# Altium project SoM_RK3588.PrjPcb (part 4 of 6)
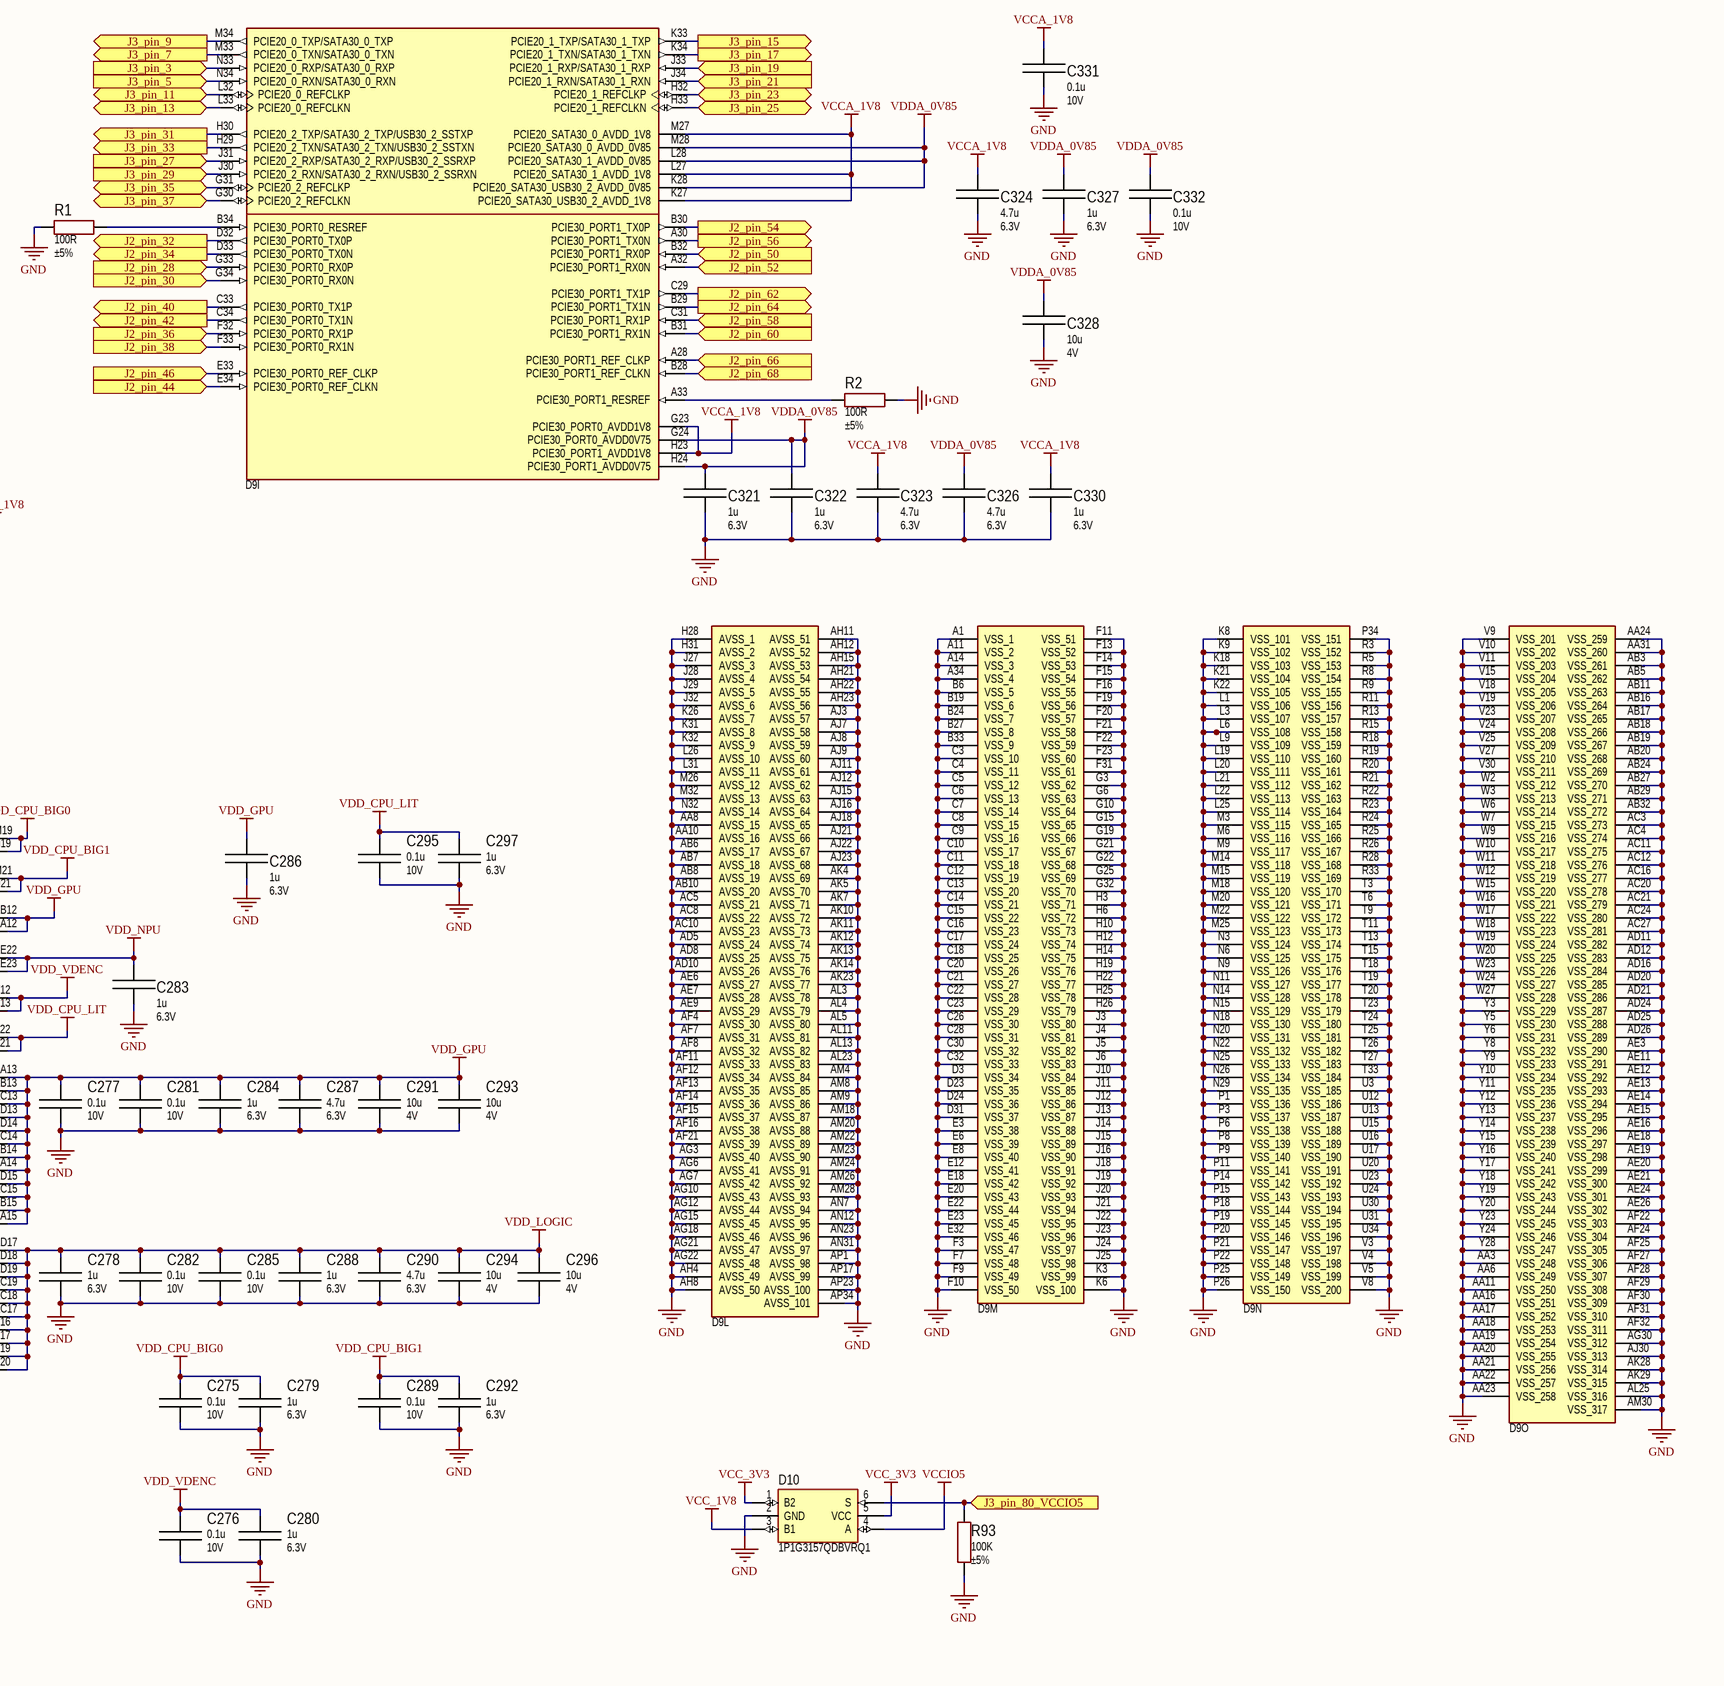
[diagram p23: 06_RK3588MQ.SchDoc, bottom right]

## Sheet 06_RK3588MQ.SchDoc (continued)

### Parts
C193  value 18p  Voltage: 50V  [CAPC1005X06N]  (hidden comment: C1005C0G1H180J050BA)
C194  value 1u  Voltage: 6.3V  [CAPC0603X03N]  (hidden comment: C0603X5R0J105M030BC)
C195  value 0.1u  Voltage: 10V  [CAPC0603X03N]  (hidden comment: C0603X5R1A104K030BC)
C196  value 1u  Voltage: 6.3V  [CAPC0603X03N]  (hidden comment: C0603X5R0J105M030BC)
C197  value 18p  Voltage: 50V  [CAPC1005X06N]  (hidden comment: C1005C0G1H180J050BA)
C198  value 0.1u  Voltage: 10V  [CAPC0603X03N]  (hidden comment: C0603X5R1A104K030BC)
C199  value 0.1u  Voltage: 10V  [CAPC0603X03N]  (hidden comment: C0603X5R1A104K030BC)
C200  value 1u  Voltage: 6.3V  [CAPC0603X03N]  (hidden comment: C0603X5R0J105M030BC)
C201  value 0.1u  Voltage: 10V  [CAPC0603X03N]  (hidden comment: C0603X5R1A104K030BC)
C202  value 0.1u  Voltage: 10V  [CAPC0603X03N]  (hidden comment: C0603X5R1A104K030BC)
C203  value 0.1u  Voltage: 10V  [CAPC0603X03N]  (hidden comment: C0603X5R1A104K030BC)
C204  value 1u  Voltage: 6.3V  [CAPC0603X03N]  (hidden comment: C0603X5R0J105M030BC)
C205  value 10u  Voltage: 4V  [CAPC1005X06N]  (hidden comment: CC0402MRX5R4BB106)
C206  value 10u  Voltage: 4V  [CAPC1005X06N]  (hidden comment: CC0402MRX5R4BB106)
C207  value 1u  Voltage: 6.3V  [CAPC0603X03N]  (hidden comment: C0603X5R0J105M030BC)
C208  value 4.7u  Voltage: 6.3V  [CAPC1005X06N]  (hidden comment: C1005X5R0J475K050BC)
C209  value 1u  Voltage: 6.3V  [CAPC0603X03N]  (hidden comment: C0603X5R0J105M030BC)
C210  value 1u  Voltage: 6.3V  [CAPC0603X03N]  (hidden comment: C0603X5R0J105M030BC)
C211  value 1u  Voltage: 6.3V  [CAPC0603X03N]  (hidden comment: C0603X5R0J105M030BC)
C212  value 0.1u  Voltage: 10V  [CAPC0603X03N]  (hidden comment: C0603X5R1A104K030BC)
C214  value 0.1u  Voltage: 10V  [CAPC0603X03N]  (hidden comment: C0603X5R1A104K030BC)
C215  value 1u  Voltage: 6.3V  [CAPC0603X03N]  (hidden comment: C0603X5R0J105M030BC)
C217  value 1u  Voltage: 6.3V  [CAPC0603X03N]  (hidden comment: C0603X5R0J105M030BC)
C219  value 0.1u  Voltage: 10V  [CAPC0603X03N]  (hidden comment: C0603X5R1A104K030BC)
C220  value 0.1u  Voltage: 10V  [CAPC0603X03N]  (hidden comment: C0603X5R1A104K030BC)
C223  value 0.1u  Voltage: 10V  [CAPC0603X03N]  (hidden comment: C0603X5R1A104K030BC)
C225  value 22u  Voltage: 6.3V  [CAPC1608X08N]  (hidden comment: C1608X5R0J226M080AC)
C227  value 10u  Voltage: 4V  [CAPC1005X06N]  (hidden comment: CC0402MRX5R4BB106)
C228  value 1u  Voltage: 6.3V  [CAPC0603X03N]  (hidden comment: C0603X5R0J105M030BC)
C230  value 10u  Voltage: 4V  [CAPC1005X06N]  (hidden comment: CC0402MRX5R4BB106)
C232  value 22u  Voltage: 6.3V  [CAPC1608X08N]  (hidden comment: C1608X5R0J226M080AC)
C233  value 1u  Voltage: 6.3V  [CAPC0603X03N]  (hidden comment: C0603X5R0J105M030BC)
C234  value 4.7u  Voltage: 6.3V  [CAPC1005X06N]  (hidden comment: C1005X5R0J475K050BC)
C235  value 22u  Voltage: 6.3V  [CAPC1608X08N]  (hidden comment: C1608X5R0J226M080AC)
C236  value 1u  Voltage: 6.3V  [CAPC0603X03N]  (hidden comment: C0603X5R0J105M030BC)
C240  value 1u  Voltage: 6.3V  [CAPC0603X03N]  (hidden comment: C0603X5R0J105M030BC)
C241  value 0.1u  Voltage: 10V  [CAPC0603X03N]  (hidden comment: C0603X5R1A104K030BC)
C243  value 10u  Voltage: 4V  [CAPC1005X06N]  (hidden comment: CC0402MRX5R4BB106)
C244  value 10u  Voltage: 4V  [CAPC1005X06N]  (hidden comment: CC0402MRX5R4BB106)
C245  value 10u  Voltage: 4V  [CAPC1005X06N]  (hidden comment: CC0402MRX5R4BB106)
C246  value 0.1u  Voltage: 10V  [CAPC0603X03N]  (hidden comment: C0603X5R1A104K030BC)
C247  value 1u  Voltage: 6.3V  [CAPC0603X03N]  (hidden comment: C0603X5R0J105M030BC)
C248  value 22u  Voltage: 6.3V  [CAPC1608X08N]  (hidden comment: C1608X5R0J226M080AC)
C249  value 10u  Voltage: 4V  [CAPC1005X06N]  (hidden comment: CC0402MRX5R4BB106)
C250  value 4.7u  Voltage: 6.3V  [CAPC1005X06N]  (hidden comment: C1005X5R0J475K050BC)
C251  value 4.7u  Voltage: 6.3V  [CAPC1005X06N]  (hidden comment: C1005X5R0J475K050BC)
C252  value 10u  Voltage: 4V  [CAPC1005X06N]  (hidden comment: CC0402MRX5R4BB106)
C253  value 0.1u  Voltage: 10V  [CAPC0603X03N]  (hidden comment: C0603X5R1A104K030BC)
C254  value 0.1u  Voltage: 10V  [CAPC0603X03N]  (hidden comment: C0603X5R1A104K030BC)
C255  value 10u  Voltage: 4V  [CAPC1005X06N]  (hidden comment: CC0402MRX5R4BB106)
C256  value 10u  Voltage: 4V  [CAPC1005X06N]  (hidden comment: CC0402MRX5R4BB106)
C257  value 1u  Voltage: 6.3V  [CAPC0603X03N]  (hidden comment: C0603X5R0J105M030BC)
C258  value 1u  Voltage: 6.3V  [CAPC0603X03N]  (hidden comment: C0603X5R0J105M030BC)
C259  value 1u  Voltage: 6.3V  [CAPC0603X03N]  (hidden comment: C0603X5R0J105M030BC)
C260  value 0.1u  Voltage: 10V  [CAPC0603X03N]  (hidden comment: C0603X5R1A104K030BC)
C261  value 1u  Voltage: 6.3V  [CAPC0603X03N]  (hidden comment: C0603X5R0J105M030BC)
C262  value 1u  Voltage: 6.3V  [CAPC0603X03N]  (hidden comment: C0603X5R0J105M030BC)
C263  value 1u  Voltage: 6.3V  [CAPC0603X03N]  (hidden comment: C0603X5R0J105M030BC)
C264  value 4.7u  Voltage: 6.3V  [CAPC1005X06N]  (hidden comment: C1005X5R0J475K050BC)
C265  value 1u  Voltage: 6.3V  [CAPC0603X03N]  (hidden comment: C0603X5R0J105M030BC)
C266  value 1u  Voltage: 6.3V  [CAPC0603X03N]  (hidden comment: C0603X5R0J105M030BC)
C267  value 0.1u  Voltage: 10V  [CAPC0603X03N]  (hidden comment: C0603X5R1A104K030BC)
C268  value 0.1u  Voltage: 10V  [CAPC0603X03N]  (hidden comment: C0603X5R1A104K030BC)
C269  value 0.1u  Voltage: 10V  [CAPC0603X03N]  (hidden comment: C0603X5R1A104K030BC)
C270  value 0.1u  Voltage: 10V  [CAPC0603X03N]  (hidden comment: C0603X5R1A104K030BC)
C271  value 0.1u  Voltage: 10V  [CAPC0603X03N]  (hidden comment: C0603X5R1A104K030BC)
C272  value 0.1u  Voltage: 10V  [CAPC0603X03N]  (hidden comment: C0603X5R1A104K030BC)
C273  value 10u  Voltage: 6.3V  [CAPC1608X08N]  (hidden comment: C1608X5R0J106K080AB)
C274  value 0.1u  Voltage: 10V  [CAPC0603X03N]  (hidden comment: C0603X5R1A104K030BC)
C275  value 0.1u  Voltage: 10V  [CAPC0603X03N]  (hidden comment: C0603X5R1A104K030BC)
C276  value 0.1u  Voltage: 10V  [CAPC0603X03N]  (hidden comment: C0603X5R1A104K030BC)
C277  value 0.1u  Voltage: 10V  [CAPC0603X03N]  (hidden comment: C0603X5R1A104K030BC)
C278  value 1u  Voltage: 6.3V  [CAPC0603X03N]  (hidden comment: C0603X5R0J105M030BC)
C279  value 1u  Voltage: 6.3V  [CAPC0603X03N]  (hidden comment: C0603X5R0J105M030BC)
C280  value 1u  Voltage: 6.3V  [CAPC0603X03N]  (hidden comment: C0603X5R0J105M030BC)
C281  value 0.1u  Voltage: 10V  [CAPC0603X03N]  (hidden comment: C0603X5R1A104K030BC)
C282  value 0.1u  Voltage: 10V  [CAPC0603X03N]  (hidden comment: C0603X5R1A104K030BC)
C283  value 1u  Voltage: 6.3V  [CAPC0603X03N]  (hidden comment: C0603X5R0J105M030BC)
C284  value 1u  Voltage: 6.3V  [CAPC0603X03N]  (hidden comment: C0603X5R0J105M030BC)
C285  value 0.1u  Voltage: 10V  [CAPC0603X03N]  (hidden comment: C0603X5R1A104K030BC)
C286  value 1u  Voltage: 6.3V  [CAPC0603X03N]  (hidden comment: C0603X5R0J105M030BC)
C287  value 4.7u  Voltage: 6.3V  [CAPC1005X06N]  (hidden comment: C1005X5R0J475K050BC)
C288  value 1u  Voltage: 6.3V  [CAPC0603X03N]  (hidden comment: C0603X5R0J105M030BC)
C289  value 0.1u  Voltage: 10V  [CAPC0603X03N]  (hidden comment: C0603X5R1A104K030BC)
C290  value 4.7u  Voltage: 6.3V  [CAPC1005X06N]  (hidden comment: C1005X5R0J475K050BC)
C291  value 10u  Voltage: 4V  [CAPC1005X06N]  (hidden comment: CC0402MRX5R4BB106)
C292  value 1u  Voltage: 6.3V  [CAPC0603X03N]  (hidden comment: C0603X5R0J105M030BC)
C293  value 10u  Voltage: 4V  [CAPC1005X06N]  (hidden comment: CC0402MRX5R4BB106)
C294  value 10u  Voltage: 4V  [CAPC1005X06N]  (hidden comment: CC0402MRX5R4BB106)
C295  value 0.1u  Voltage: 10V  [CAPC0603X03N]  (hidden comment: C0603X5R1A104K030BC)
C296  value 10u  Voltage: 4V  [CAPC1005X06N]  (hidden comment: CC0402MRX5R4BB106)
C297  value 1u  Voltage: 6.3V  [CAPC0603X03N]  (hidden comment: C0603X5R0J105M030BC)
C303  value 0.1u  Voltage: 10V  [CAPC0603X03N]  (hidden comment: C0603X5R1A104K030BC)
C304  value 1u  Voltage: 6.3V  [CAPC0603X03N]  (hidden comment: C0603X5R0J105M030BC)
C305  value 0.1u  Voltage: 10V  [CAPC0603X03N]  (hidden comment: C0603X5R1A104K030BC)
C306  value 0.1u  Voltage: 10V  [CAPC0603X03N]  (hidden comment: C0603X5R1A104K030BC)
C307  value 0.1u  Voltage: 10V  [CAPC0603X03N]  (hidden comment: C0603X5R1A104K030BC)
C308  value 0.1u  Voltage: 10V  [CAPC0603X03N]  (hidden comment: C0603X5R1A104K030BC)
C309  value 0.1u  Voltage: 10V  [CAPC0603X03N]  (hidden comment: C0603X5R1A104K030BC)
C310  value 1u  Voltage: 6.3V  [CAPC0603X03N]  (hidden comment: C0603X5R0J105M030BC)
C311  value 0.1u  Voltage: 10V  [CAPC0603X03N]  (hidden comment: C0603X5R1A104K030BC)
C312  value 4.7u  Voltage: 6.3V  [CAPC1005X06N]  (hidden comment: C1005X5R0J475K050BC)
C313  value 1u  Voltage: 6.3V  [CAPC0603X03N]  (hidden comment: C0603X5R0J105M030BC)
C314  value 0.1u  Voltage: 10V  [CAPC0603X03N]  (hidden comment: C0603X5R1A104K030BC)
C316  value 0.1u  Voltage: 10V  [CAPC0603X03N]  (hidden comment: C0603X5R1A104K030BC)
C317  value 1u  Voltage: 6.3V  [CAPC0603X03N]  (hidden comment: C0603X5R0J105M030BC)
C318  value 4.7u  Voltage: 6.3V  [CAPC1005X06N]  (hidden comment: C1005X5R0J475K050BC)
C319  value 1u  Voltage: 6.3V  [CAPC0603X03N]  (hidden comment: C0603X5R0J105M030BC)
C320  value 4.7u  Voltage: 6.3V  [CAPC1005X06N]  (hidden comment: C1005X5R0J475K050BC)
C321  value 1u  Voltage: 6.3V  [CAPC0603X03N]  (hidden comment: C0603X5R0J105M030BC)
C322  value 1u  Voltage: 6.3V  [CAPC0603X03N]  (hidden comment: C0603X5R0J105M030BC)
C323  value 4.7u  Voltage: 6.3V  [CAPC1005X06N]  (hidden comment: C1005X5R0J475K050BC)
C324  value 4.7u  Voltage: 6.3V  [CAPC1005X06N]  (hidden comment: C1005X5R0J475K050BC)
C325  value 0.1u  Voltage: 10V  [CAPC0603X03N]  (hidden comment: C0603X5R1A104K030BC)
C326  value 4.7u  Voltage: 6.3V  [CAPC1005X06N]  (hidden comment: C1005X5R0J475K050BC)
C327  value 1u  Voltage: 6.3V  [CAPC0603X03N]  (hidden comment: C0603X5R0J105M030BC)
C328  value 10u  Voltage: 4V  [CAPC1005X06N]  (hidden comment: CC0402MRX5R4BB106)
C329  value 0.1u  Voltage: 10V  [CAPC0603X03N]  (hidden comment: C0603X5R1A104K030BC)
C330  value 1u  Voltage: 6.3V  [CAPC0603X03N]  (hidden comment: C0603X5R0J105M030BC)
C331  value 0.1u  Voltage: 10V  [CAPC0603X03N]  (hidden comment: C0603X5R1A104K030BC)
C332  value 0.1u  Voltage: 10V  [CAPC0603X03N]  (hidden comment: C0603X5R1A104K030BC)
C333  value 0.1u  Voltage: 10V  [CAPC0603X03N]  (hidden comment: C0603X5R1A104K030BC)
C334  value 0.1u  Voltage: 10V  [CAPC0603X03N]  (hidden comment: C0603X5R1A104K030BC)
C335  value 0.1u  Voltage: 10V  [CAPC0603X03N]  (hidden comment: C0603X5R1A104K030BC)
C336  value 0.1u  Voltage: 10V  [CAPC0603X03N]  (hidden comment: C0603X5R1A104K030BC)
C337  value 0.1u  Voltage: 10V  [CAPC0603X03N]  (hidden comment: C0603X5R1A104K030BC)
C338  value 0.1u  Voltage: 10V  [CAPC0603X03N]  (hidden comment: C0603X5R1A104K030BC)
C339  value 0.1u  Voltage: 10V  [CAPC0603X03N]  (hidden comment: C0603X5R1A104K030BC)
C340  value 0.1u  Voltage: 10V  [CAPC0603X03N]  (hidden comment: C0603X5R1A104K030BC)
C341  value 0.1u  Voltage: 10V  [CAPC0603X03N]  (hidden comment: C0603X5R1A104K030BC)
C342  value 0.1u  Voltage: 10V  [CAPC0603X03N]  (hidden comment: C0603X5R1A104K030BC)
C343  value 0.1u  Voltage: 10V  [CAPC0603X03N]  (hidden comment: C0603X5R1A104K030BC)
C344  value 0.1u  Voltage: 10V  [CAPC0603X03N]  (hidden comment: C0603X5R1A104K030BC)
C345  value 0.1u  Voltage: 10V  [CAPC0603X03N]  (hidden comment: C0603X5R1A104K030BC)
C346  value 0.1u  Voltage: 10V  [CAPC0603X03N]  (hidden comment: C0603X5R1A104K030BC)
C347  value 0.1u  Voltage: 10V  [CAPC0603X03N]  (hidden comment: C0603X5R1A104K030BC)
C348  value 0.1u  Voltage: 10V  [CAPC0603X03N]  (hidden comment: C0603X5R1A104K030BC)
C349  value 0.1u  Voltage: 10V  [CAPC0603X03N]  (hidden comment: C0603X5R1A104K030BC)
C350  value 0.1u  Voltage: 10V  [CAPC0603X03N]  (hidden comment: C0603X5R1A104K030BC)
C351  value 0.1u  Voltage: 10V  [CAPC0603X03N]  (hidden comment: C0603X5R1A104K030BC)
C352  value 0.1u  Voltage: 10V  [CAPC0603X03N]  (hidden comment: C0603X5R1A104K030BC)
D9  RK3588M  [BGA1088C65P34X34_2300X2300X204N]  (value not drawn)  (parts A,B,C,D,E,F,G,H,I,J,K,L,M,N,O of 15)
D10  1P1G3157QDBVRQ1  [SOT95P280X145-6N]
R1  value 100R  Tolerance: ±5%  [RESC1005X04N]  (hidden comment: RC0402JR-07100RL)
R2  value 100R  Tolerance: ±5%  [RESC1005X04N]  (hidden comment: RC0402JR-07100RL)
R73  value 240R  Tolerance: ±1%  [RESC0603X02N]  (hidden comment: RC0201FR-07240RL)
R74  value 22R  Tolerance: ±5%  [RESC1005X04N]  (hidden comment: RC0402JR-0722RL)
R75  value 510K  Tolerance: ±5%  [RESC1005X04N]  (hidden comment: RC0402JR-07510KL)
R76  value 240R  Tolerance: ±1%  [RESC0603X02N]  (hidden comment: RC0201FR-07240RL)
R77  value 22R  Tolerance: ±5%  [RESC1005X04N]  (hidden comment: RC0402JR-0722RL)
R78  value 100K  Tolerance: ±5%  [RESC1005X04N]  (hidden comment: RC0402JR-07100KL)
R79  value NC  [RESC1005X04N]  (hidden comment: NC0402)  (no BOM)
R80  value 120K  Tolerance: ±5%  [RESC1005X04N]  (hidden comment: RC0402JR-07120KL)
R81  value 240R  Tolerance: ±1%  [RESC0603X02N]  (hidden comment: RC0201FR-07240RL)
R82  value 240R  Tolerance: ±1%  [RESC0603X02N]  (hidden comment: RC0201FR-07240RL)
R83  value 2K2  Tolerance: ±5%  [RESC0603X02N]  (hidden comment: RC0201JR-072K2L)
R84  value 2K2  Tolerance: ±5%  [RESC0603X02N]  (hidden comment: RC0201JR-072K2L)
R85  value 100K  Tolerance: ±5%  [RESC1005X04N]  (hidden comment: RC0402JR-07100KL)
R86  value 120K  Tolerance: ±5%  [RESC1005X04N]  (hidden comment: RC0402JR-07120KL)
R87  value 22R  Tolerance: ±5%  [RESC1005X04N]  (hidden comment: RC0402JR-0722RL)
R88  value 0R  Tolerance: ±1%  [RESC1608X05N]  (hidden comment: RC0603JR-070RL)
R89  value 0R  Tolerance: ±1%  [RESC1608X05N]  (hidden comment: RC0603JR-070RL)
R90  value 0R  Tolerance: ±5%  [RESC0603X02N]  (hidden comment: RC0201JR-070RL)
R91  value 22R  Tolerance: ±5%  [RESC1005X04N]  (hidden comment: RC0402JR-0722RL)
R92  value 0R  Tolerance: ±5%  [RESC0603X02N]  (hidden comment: RC0201JR-070RL)
R93  value 100K  Tolerance: ±5%  [RESC1005X04N]  (hidden comment: RC0402JR-07100KL)
R94  value NC  [RESC1005X04N]  (hidden comment: NC0402)  (no BOM)
R95  value NC  [RESC1005X04N]  (hidden comment: NC0402)  (no BOM)
R96  value NC  [RESC1005X04N]  (hidden comment: NC0402)  (no BOM)
R97  value NC  [RESC1005X04N]  (hidden comment: NC0402)  (no BOM)
ZQ1  E3SB24.0000F08E11  [X322525MOB4SI]  (value not drawn)

### Ports
DDR_CH0_A0_A (out), DDR_CH0_A0_B (out), DDR_CH0_A1_A (out), DDR_CH0_A1_B (out), DDR_CH0_A2_A (out), DDR_CH0_A2_B (out), DDR_CH0_A3_A (out), DDR_CH0_A3_B (out), DDR_CH0_A4_A (out), DDR_CH0_A4_B (out), DDR_CH0_A5_A (out), DDR_CH0_A5_B (out), DDR_CH0_CLKN_A (out), DDR_CH0_CLKN_B (out), DDR_CH0_CLKP_A (out), DDR_CH0_CLKP_B (out), DDR_CH0_DM0_A (out), DDR_CH0_DM0_B (out), DDR_CH0_DM1_A (out), DDR_CH0_DM1_B (out), DDR_CH0_DQ0_A (bidir), DDR_CH0_DQ0_B (bidir), DDR_CH0_DQ1_A (bidir), DDR_CH0_DQ1_B (bidir), DDR_CH0_DQ2_A (bidir), DDR_CH0_DQ2_B (bidir), DDR_CH0_DQ3_A (bidir), DDR_CH0_DQ3_B (bidir), DDR_CH0_DQ4_A (bidir), DDR_CH0_DQ4_B (bidir), DDR_CH0_DQ5_A (bidir), DDR_CH0_DQ5_B (bidir), DDR_CH0_DQ6_A (bidir), DDR_CH0_DQ6_B (bidir), DDR_CH0_DQ7_A (bidir), DDR_CH0_DQ7_B (bidir), DDR_CH0_DQ8_A (bidir), DDR_CH0_DQ8_B (bidir), DDR_CH0_DQ9_A (bidir), DDR_CH0_DQ9_B (bidir), DDR_CH0_DQ10_A (bidir), DDR_CH0_DQ10_B (bidir), DDR_CH0_DQ11_A (bidir), DDR_CH0_DQ11_B (bidir), DDR_CH0_DQ12_A (bidir), DDR_CH0_DQ12_B (bidir), DDR_CH0_DQ13_A (bidir), DDR_CH0_DQ13_B (bidir), DDR_CH0_DQ14_A (bidir), DDR_CH0_DQ14_B (bidir), DDR_CH0_DQ15_A (bidir), DDR_CH0_DQ15_B (bidir), DDR_CH0_DQS0N_A (bidir), DDR_CH0_DQS0N_B (bidir), DDR_CH0_DQS0P_A (bidir), DDR_CH0_DQS0P_B (bidir), DDR_CH0_DQS1N_A (bidir), DDR_CH0_DQS1N_B (bidir), DDR_CH0_DQS1P_A (bidir), DDR_CH0_DQS1P_B (bidir), DDR_CH0_LP4/4X_CKE0/LP5_CS0_A (out), DDR_CH0_LP4/4X_CKE0/LP5_CS0_B (out), DDR_CH0_LP4/4X_CKE1/LP5_CS1_A (out), DDR_CH0_LP4/4X_CKE1/LP5_CS1_B (out), DDR_CH0_LP4/4X_CS0_A (out), DDR_CH0_LP4/4X_CS0_B (out), DDR_CH0_LP4/4X_CS1_A (out), DDR_CH0_LP4/4X_CS1_B (out), DDR_CH1_A0_C (out), DDR_CH1_A0_D (out), DDR_CH1_A1_C (out), DDR_CH1_A1_D (out), DDR_CH1_A2_C (out), DDR_CH1_A2_D (out), DDR_CH1_A3_C (out), DDR_CH1_A3_D (out), DDR_CH1_A4_C (out), DDR_CH1_A4_D (out), DDR_CH1_A5_C (out), DDR_CH1_A5_D (out), DDR_CH1_CLKN_C (out), DDR_CH1_CLKN_D (out), DDR_CH1_CLKP_C (out), DDR_CH1_CLKP_D (out), DDR_CH1_DM0_C (out), DDR_CH1_DM0_D (out), DDR_CH1_DM1_C (out), DDR_CH1_DM1_D (out), DDR_CH1_DQ0_C (bidir), DDR_CH1_DQ0_D (bidir), DDR_CH1_DQ1_C (bidir), DDR_CH1_DQ1_D (bidir), DDR_CH1_DQ2_C (bidir), DDR_CH1_DQ2_D (bidir), DDR_CH1_DQ3_C (bidir), DDR_CH1_DQ3_D (bidir), DDR_CH1_DQ4_C (bidir), DDR_CH1_DQ4_D (bidir), DDR_CH1_DQ5_C (bidir), DDR_CH1_DQ5_D (bidir), DDR_CH1_DQ6_C (bidir), DDR_CH1_DQ6_D (bidir), DDR_CH1_DQ7_C (bidir), DDR_CH1_DQ7_D (bidir), DDR_CH1_DQ8_C (bidir), DDR_CH1_DQ8_D (bidir), DDR_CH1_DQ9_C (bidir), DDR_CH1_DQ9_D (bidir), DDR_CH1_DQ10_C (bidir), DDR_CH1_DQ10_D (bidir), DDR_CH1_DQ11_C (bidir), DDR_CH1_DQ11_D (bidir), DDR_CH1_DQ12_C (bidir), DDR_CH1_DQ12_D (bidir), DDR_CH1_DQ13_C (bidir), DDR_CH1_DQ13_D (bidir), DDR_CH1_DQ14_C (bidir), DDR_CH1_DQ14_D (bidir), DDR_CH1_DQ15_C (bidir), DDR_CH1_DQ15_D (bidir), DDR_CH1_DQS0N_C (bidir), DDR_CH1_DQS0N_D (bidir), DDR_CH1_DQS0P_C (bidir), DDR_CH1_DQS0P_D (bidir), DDR_CH1_DQS1N_C (bidir), DDR_CH1_DQS1N_D (bidir), DDR_CH1_DQS1P_C (bidir), DDR_CH1_DQS1P_D (bidir), DDR_CH1_LP4/4X_CKE0/LP5_CS0_C (out), DDR_CH1_LP4/4X_CKE0/LP5_CS0_D (out), DDR_CH1_LP4/4X_CKE1/LP5_CS1_C (out), DDR_CH1_LP4/4X_CKE1/LP5_CS1_D (out), DDR_CH1_LP4/4X_CS0_C (out), DDR_CH1_LP4/4X_CS0_D (out), DDR_CH1_LP4/4X_CS1_C (out), DDR_CH1_LP4/4X_CS1_D (out), DDR_RESET (out), eMMC_CLKOUT (out), eMMC_CMD (out), eMMC_D0 (bidir), eMMC_D1 (bidir), eMMC_D2 (bidir), eMMC_D3 (bidir), eMMC_D4 (bidir), eMMC_D5 (bidir), eMMC_D6 (bidir), eMMC_D7 (bidir), eMMC_DATA_STROBE (out), eMMC_RSTn (out), I2C0_SCL_M2 (out), I2C0_SDA_M2 (bidir), J1_pin_22_3V3 (bidir), J1_pin_23_3V3 (bidir), J1_pin_24_VCCIO5 (bidir), J1_pin_25_3V3 (bidir), J1_pin_26_VCCIO5 (bidir), J1_pin_27_3V3 (bidir), J1_pin_28_VCCIO5 (bidir), J1_pin_29_3V3 (bidir), J1_pin_30_3V3 (bidir), J1_pin_31_3V3 (in), J1_pin_32_3V3 (bidir), J1_pin_33_3V3 (in), J1_pin_34_3V3 (bidir), J1_pin_35_1V8 (in), J1_pin_36_3V3 (bidir), J1_pin_37_3V3 (in), J1_pin_38_3V3 (bidir), J1_pin_39_VCCIO5 (bidir), J1_pin_40_3V3 (bidir), J1_pin_41_VCCIO5 (bidir), J1_pin_42_3V3 (bidir), J1_pin_43_VCCIO5 (bidir), J1_pin_46_1V8 (bidir), J1_pin_48_VCCIO_SD_S0 (bidir), J1_pin_50_VCCIO_SD_S0 (bidir), J1_pin_52_VCCIO_SD_S0 (bidir), J1_pin_54_VCCIO_SD_S0 (bidir), J1_pin_56_VCCIO_SD_S0 (bidir), J1_pin_58_VCCIO_SD_S0 (bidir), J1_pin_62_3V3 (bidir), J1_pin_64_3V3 (bidir), J1_pin_65 (bidir), J1_pin_66 (in), J1_pin_67 (bidir), J1_pin_68 (in), J1_pin_69 (bidir), J1_pin_70 (out), J1_pin_71 (bidir), J1_pin_72 (out), J1_pin_73 (bidir), J1_pin_74 (bidir), J1_pin_75 (bidir), J1_pin_76 (bidir), J1_pin_77 (bidir), J1_pin_78 (out), J1_pin_79 (bidir), J1_pin_80 (out), J2_pin_28 (in), J2_pin_30 (in), J2_pin_32 (out), J2_pin_34 (out), J2_pin_36 (in), J2_pin_38 (in), J2_pin_40 (out), J2_pin_41 (out), J2_pin_42 (out), J2_pin_43 (out), J2_pin_44 (in), J2_pin_45 (bidir), J2_pin_46 (in), J2_pin_47 (bidir), J2_pin_49 (out), J2_pin_50 (in), J2_pin_51 (out), J2_pin_52 (in), J2_pin_53 (in), J2_pin_54 (out), J2_pin_55 (in), J2_pin_56 (out), J2_pin_58 (in), J2_pin_60 (in), J2_pin_62 (out), J2_pin_64 (out), J2_pin_66 (in), J2_pin_68 (in), J2_pin_94_1V8 (in), J2_pin_96_1V8 (in), J2_pin_98 (bidir), J2_pin_100 (bidir), J3_pin_2_3V3 (bidir), J3_pin_3 (in), J3_pin_4_3V3 (bidir), J3_pin_5 (in), J3_pin_6_1V8 (bidir), J3_pin_7 (out), J3_pin_8_1V8 (bidir), J3_pin_9 (out), J3_pin_10_1V8 (bidir), J3_pin_11 (bidir), J3_pin_12_1V8 (bidir), J3_pin_13 (bidir), J3_pin_14_1V8 (bidir), J3_pin_15 (out), J3_pin_16_1V8 (bidir), J3_pin_17 (out), J3_pin_18_1V8 (bidir), J3_pin_19 (in), J3_pin_20_VCCIO5 (bidir), J3_pin_21 (in), J3_pin_22_VCCIO5 (bidir), J3_pin_23 (bidir), J3_pin_24_1V8 (bidir), J3_pin_25 (bidir), J3_pin_26_1V8 (bidir), J3_pin_27 (in), J3_pin_28_UART2_RX_M0_DEBUG (in), J3_pin_29 (in), J3_pin_30_UART2_TX_M0_DEBUG (out), J3_pin_31 (out), J3_pin_32_VCCIO5 (bidir), J3_pin_33 (out), J3_pin_34_1V8 (bidir), J3_pin_35 (bidir), J3_pin_36_1V8 (bidir), J3_pin_37 (bidir), J3_pin_38_1V8 (bidir), J3_pin_40_1V8 (bidir), J3_pin_41_1V8 (bidir), J3_pin_42_1V8 (bidir), J3_pin_43_1V8 (bidir), J3_pin_44_1V8 (bidir), J3_pin_45_1V8 (bidir), J3_pin_46_1V8 (bidir), J3_pin_47_1V8 (bidir), J3_pin_48_1V8 (bidir), J3_pin_49_1V8 (bidir), J3_pin_50_1V8 (bidir), J3_pin_51_1V8 (bidir), J3_pin_52_1V8 (bidir), J3_pin_53_1V8 (bidir), J3_pin_54_1V8 (bidir), J3_pin_55_1V8 (bidir), J3_pin_56_1V8 (bidir), J3_pin_57_1V8 (bidir), J3_pin_58_1V8 (bidir), J3_pin_59_1V8 (bidir), J3_pin_60_1V8 (bidir), J3_pin_61_1V8 (bidir), J3_pin_62_1V8 (bidir), J3_pin_63_1V8 (bidir), J3_pin_64_1V8 (bidir), J3_pin_66_1V8 (bidir), J3_pin_67_VCCIO5 (bidir), J3_pin_68_1V8 (bidir), J3_pin_69_1V8 (bidir), J3_pin_70_1V8 (bidir), J3_pin_71_1V8 (bidir), J3_pin_72_1V8 (bidir), J3_pin_73_1V8 (bidir), J3_pin_74_VCCIO5 (bidir), J3_pin_75_1V8 (bidir), J3_pin_76_VCCIO5 (bidir), J3_pin_77_1V8 (bidir), J3_pin_78_VCCIO5 (bidir), J3_pin_79_1V8 (bidir), J3_pin_80_VCCIO5 (in), J4_pin_10 (in), J4_pin_12 (in), J4_pin_14 (in), J4_pin_16 (in), J4_pin_18 (in), J4_pin_20 (in), J4_pin_22 (in), J4_pin_24 (in), J4_pin_26 (in), J4_pin_28 (in), J4_pin_30 (in), J4_pin_32 (in), J4_pin_35_1V8 (in), J4_pin_37_1V8 (in), J4_pin_38_1V8 (bidir), J4_pin_39_1V8 (in), J4_pin_40_1V8 (bidir), J4_pin_41_1V8 (in), J4_pin_42_1V8 (in), J4_pin_43_3V3 (bidir), J4_pin_46_3V3 (bidir), J4_pin_47_1V8 (bidir), J4_pin_49_1V8 (bidir), J4_pin_50_1V8 (bidir), J4_pin_51_1V8 (bidir), J4_pin_52_1V8 (bidir), J4_pin_53_1V8 (bidir), J4_pin_54_1V8 (bidir), J4_pin_55_1V8 (bidir), J4_pin_56_1V8 (bidir), J4_pin_57_1V8 (bidir), J4_pin_58_1V8 (bidir), J4_pin_59_VCCIO5 (bidir), J4_pin_60_1V8 (bidir), J4_pin_61_VCCIO5 (bidir), J4_pin_62_1V8 (bidir), J4_pin_63_VCCIO5 (bidir), J4_pin_64_1V8 (bidir), J4_pin_65_VCCIO5 (bidir), J4_pin_66_VCCIO5 (bidir), J4_pin_67_VCCIO5 (bidir), J4_pin_68_1V8 (bidir), J4_pin_69_VCCIO5 (bidir), J4_pin_70_1V8 (bidir), J4_pin_71_VCCIO5 (bidir), J4_pin_72_VCCIO5 (bidir), J4_pin_73_VCCIO5 (bidir), J4_pin_74_VCCIO5 (bidir), J4_pin_75_VCCIO5 (bidir), J4_pin_76_VCCIO5 (bidir), J4_pin_77_VCCIO5 (bidir), J4_pin_78_VCCIO5 (bidir), J4_pin_79_VCCIO5 (bidir), J4_pin_80_VCCIO5 (bidir), PMIC_INT_L (in), PMIC_PWR_CTRL1 (out), PMIC_PWR_CTRL2 (out), PMIC_PWR_CTRL3 (in), PMIC_SPI_CLK (out), PMIC_SPI_CS (out), PMIC_SPI_MOSI (bidir), RESET_L (in), VSEL2 (out), VSEL3 (out), VSEL6 (in)